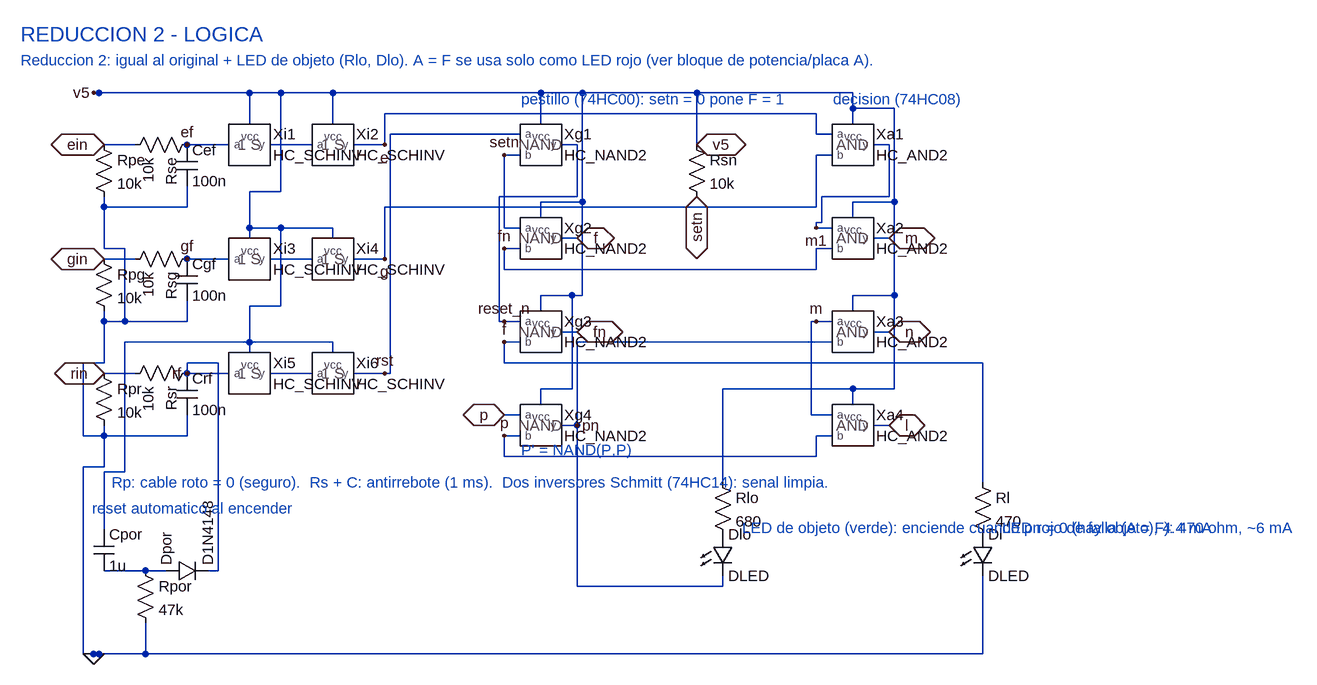
[diagram p0: schematic BLOQUE_LOGICA.asc]
BLOQUE_LOGICA.asc, the LTspice schematic file:
Version 4
SHEET 1 1700 1000
WIRE 48 0 96 0
WIRE 176 0 240 0
WIRE 304 0 368 0
WIRE 432 0 480 0
WIRE 48 176 96 176
WIRE 176 176 240 176
WIRE 304 176 368 176
WIRE 432 176 480 176
WIRE 48 352 96 352
WIRE 176 352 240 352
WIRE 304 352 368 352
WIRE 432 352 480 352
WIRE 48 656 112 656
WIRE 112 656 144 656
WIRE 752 0 776 0
WIRE 720 -32 720 -56
WIRE 688 -16 664 -16
WIRE 688 16 664 16
WIRE 752 144 776 144
WIRE 720 112 720 88
WIRE 688 128 664 128
WIRE 688 160 664 160
WIRE 752 288 776 288
WIRE 720 256 720 232
WIRE 688 272 664 272
WIRE 688 304 664 304
WIRE 752 432 776 432
WIRE 720 400 720 376
WIRE 688 416 664 416
WIRE 688 448 664 448
WIRE 1232 0 1256 0
WIRE 1200 -32 1200 -56
WIRE 1168 -16 1144 -16
WIRE 1168 16 1144 16
WIRE 1232 144 1256 144
WIRE 1200 112 1200 88
WIRE 1168 128 1144 128
WIRE 1168 160 1144 160
WIRE 1232 288 1256 288
WIRE 1200 256 1200 232
WIRE 1168 272 1144 272
WIRE 1168 304 1144 304
WIRE 1232 432 1256 432
WIRE 1200 400 1200 376
WIRE 1168 416 1144 416
WIRE 1168 448 1144 448
WIRE 1144 -16 1144 -48
WIRE 1144 -48 480 -48
WIRE 480 -48 480 0
WIRE 1400 520 1400 336
WIRE 1400 336 664 336
WIRE 664 336 664 304
WIRE 1144 160 1144 192
WIRE 1144 192 664 192
WIRE 664 192 664 160
WIRE 1144 16 1144 96
WIRE 1144 96 480 96
WIRE 480 96 480 176
WIRE 1144 416 1136 416
WIRE 1136 416 1136 272
WIRE 1136 272 1144 272
WIRE 1256 0 1256 80
WIRE 1256 80 1152 80
WIRE 1152 80 1152 120
WIRE 1152 120 1144 120
WIRE 1144 120 1144 128
WIRE 1144 448 1144 480
WIRE 1144 480 664 480
WIRE 664 480 664 448
WIRE 776 0 776 80
WIRE 776 80 656 80
WIRE 656 80 656 272
WIRE 656 272 664 272
WIRE 208 656 224 656
WIRE 224 656 224 336
WIRE 224 336 176 336
WIRE 176 336 176 352
WIRE 664 -16 488 -16
WIRE 488 -16 488 352
WIRE 488 352 480 352
WIRE 664 128 664 16
WIRE 1000 664 1000 680
WIRE 1000 680 776 680
WIRE 776 680 776 432
WIRE 1144 304 776 304
WIRE 776 304 776 432
WIRE 32 -80 1200 -80
WIRE 32 -80 40 -80
WIRE 720 -56 720 -80
WIRE 1200 -56 1200 -80
WIRE 272 -32 272 -80
WIRE 400 -32 400 -80
WIRE 960 0 960 -80
WIRE 720 88 784 88
WIRE 784 88 784 -80
WIRE 1200 88 1264 88
WIRE 1264 88 1264 -56
WIRE 1264 -56 1200 -56
WIRE 720 232 784 232
WIRE 784 232 784 88
WIRE 1200 232 1264 232
WIRE 1264 232 1264 88
WIRE 720 376 768 376
WIRE 768 376 768 232
WIRE 1200 376 1264 376
WIRE 1264 376 1264 232
WIRE 272 144 272 72
WIRE 272 72 320 72
WIRE 320 72 320 -80
WIRE 400 144 400 128
WIRE 400 128 272 128
WIRE 272 320 272 248
WIRE 272 248 320 248
WIRE 320 248 320 128
WIRE 400 320 400 304
WIRE 400 304 272 304
WIRE 1000 520 1000 376
WIRE 1000 376 1200 376
WIRE 48 592 48 504
WIRE 48 504 80 504
WIRE 80 504 80 304
WIRE 80 304 272 304
WIRE 32 784 1400 784
WIRE 32 784 40 784
WIRE 112 736 112 784
WIRE 1400 664 1400 784
WIRE 48 432 48 496
WIRE 48 496 16 496
WIRE 16 496 16 784
WIRE 16 784 32 784
WIRE 176 416 176 448
WIRE 176 448 48 448
WIRE 48 256 48 336
WIRE 48 336 16 336
WIRE 16 336 16 448
WIRE 16 448 48 448
WIRE 176 240 176 272
WIRE 176 272 48 272
WIRE 48 80 48 160
WIRE 48 160 80 160
WIRE 80 160 80 272
WIRE 176 64 176 96
WIRE 176 96 48 96
FLAG 48 0 ein
FLAG 176 0 ef
FLAG 480 0 e
FLAG 48 176 gin
FLAG 176 176 gf
FLAG 480 176 g
FLAG 48 352 rin
FLAG 176 352 rf
FLAG 480 352 rst
FLAG 664 16 setn
FLAG 776 144 f
FLAG 664 160 fn
FLAG 776 288 fn
FLAG 664 272 reset_n
FLAG 664 304 f
FLAG 776 432 pn
FLAG 664 416 p
FLAG 664 448 p
FLAG 960 0 v5
FLAG 960 80 setn
FLAG 1256 144 m
FLAG 1144 128 m1
FLAG 1256 288 n
FLAG 1144 272 m
FLAG 1256 432 l
FLAG 32 -80 v5
FLAG 32 784 0
IOPIN 48 0 BiDir
IOPIN 48 176 BiDir
IOPIN 48 352 BiDir
IOPIN 776 144 BiDir
IOPIN 776 288 BiDir
IOPIN 664 416 BiDir
IOPIN 960 0 BiDir
IOPIN 960 80 BiDir
IOPIN 1256 144 BiDir
IOPIN 1256 288 BiDir
IOPIN 1256 432 BiDir
SYMBOL res 32 -16 R0
SYMATTR InstName Rpe
SYMATTR Value 10k
SYMBOL res 192 -16 R90
SYMATTR InstName Rse
SYMATTR Value 10k
SYMBOL cap 160 0 R0
SYMATTR InstName Cef
SYMATTR Value 100n
SYMBOL HC_SCHINV 272 0 R0
SYMATTR InstName Xi1
SYMATTR Value HC_SCHINV
SYMBOL HC_SCHINV 400 0 R0
SYMATTR InstName Xi2
SYMATTR Value HC_SCHINV
SYMBOL res 32 160 R0
SYMATTR InstName Rpg
SYMATTR Value 10k
SYMBOL res 192 160 R90
SYMATTR InstName Rsg
SYMATTR Value 10k
SYMBOL cap 160 176 R0
SYMATTR InstName Cgf
SYMATTR Value 100n
SYMBOL HC_SCHINV 272 176 R0
SYMATTR InstName Xi3
SYMATTR Value HC_SCHINV
SYMBOL HC_SCHINV 400 176 R0
SYMATTR InstName Xi4
SYMATTR Value HC_SCHINV
SYMBOL res 32 336 R0
SYMATTR InstName Rpr
SYMATTR Value 10k
SYMBOL res 192 336 R90
SYMATTR InstName Rsr
SYMATTR Value 10k
SYMBOL cap 160 352 R0
SYMATTR InstName Crf
SYMATTR Value 100n
SYMBOL HC_SCHINV 272 352 R0
SYMATTR InstName Xi5
SYMATTR Value HC_SCHINV
SYMBOL HC_SCHINV 400 352 R0
SYMATTR InstName Xi6
SYMATTR Value HC_SCHINV
SYMBOL cap 32 592 R0
SYMATTR InstName Cpor
SYMATTR Value 1u
SYMBOL res 96 640 R0
SYMATTR InstName Rpor
SYMATTR Value 47k
SYMBOL diode 144 672 R270
SYMATTR InstName Dpor
SYMATTR Value D1N4148
SYMBOL HC_NAND2 720 0 R0
SYMATTR InstName Xg1
SYMATTR Value HC_NAND2
SYMBOL HC_NAND2 720 144 R0
SYMATTR InstName Xg2
SYMATTR Value HC_NAND2
SYMBOL HC_NAND2 720 288 R0
SYMATTR InstName Xg3
SYMATTR Value HC_NAND2
SYMBOL HC_NAND2 720 432 R0
SYMATTR InstName Xg4
SYMATTR Value HC_NAND2
SYMBOL res 944 -16 R0
SYMATTR InstName Rsn
SYMATTR Value 10k
SYMBOL HC_AND2 1200 0 R0
SYMATTR InstName Xa1
SYMATTR Value HC_AND2
SYMBOL HC_AND2 1200 144 R0
SYMATTR InstName Xa2
SYMATTR Value HC_AND2
SYMBOL HC_AND2 1200 288 R0
SYMATTR InstName Xa3
SYMATTR Value HC_AND2
SYMBOL HC_AND2 1200 432 R0
SYMATTR InstName Xa4
SYMATTR Value HC_AND2
SYMBOL res 984 504 R0
SYMATTR InstName Rlo
SYMATTR Value 680
SYMBOL LED 984 600 R0
SYMATTR InstName Dlo
SYMATTR Value DLED
SYMBOL res 1384 504 R0
SYMATTR InstName Rl
SYMATTR Value 470
SYMBOL LED 1384 600 R0
SYMATTR InstName Dl
SYMATTR Value DLED
TEXT 60 520 Left 2 ;Rp: cable roto = 0 (seguro).  Rs + C: antirrebote (1 ms).  Dos inversores Schmitt (74HC14): senal limpia.
TEXT 30 560 Left 2 ;reset automatico al encender
TEXT 690 -70 Left 2 ;pestillo (74HC00): setn = 0 pone F = 1
TEXT 690 470 Left 2 ;P' = NAND(P,P)
TEXT 1170 -70 Left 2 ;decision (74HC08)
TEXT 1430 590 Left 2 ;LED rojo de falla (A = F): 470 ohm, ~6 mA
TEXT 1030 590 Left 2 ;LED de objeto (verde): enciende cuando pn = 0 (hay objeto), 4.4 mA
TEXT -80 -170 Left 3 ;REDUCCION 2 - LOGICA
TEXT -80 -130 Left 2 ;Reduccion 2: igual al original + LED de objeto (Rlo, Dlo). A = F se usa solo como LED rojo (ver bloque de potencia/placa A).

The netlist it stands for:
* BLOQUE_LOGICA.asc
Rpe ein 0 10k
Rse ef ein 10k
Cef ef 0 100n
XXi1 ef N001 v5 HC_SCHINV  ; pins a y vcc
XXi2 N001 e v5 HC_SCHINV  ; pins a y vcc
Rpg gin 0 10k
Rsg gf gin 10k
Cgf gf 0 100n
XXi3 gf N002 v5 HC_SCHINV  ; pins a y vcc
XXi4 N002 g v5 HC_SCHINV  ; pins a y vcc
Rpr rin 0 10k
Rsr rf rin 10k
Crf rf 0 100n
XXi5 rf N003 v5 HC_SCHINV  ; pins a y vcc
XXi6 N003 rst v5 HC_SCHINV  ; pins a y vcc
Cpor v5 N004 1u
Rpor N004 0 47k
Dpor N004 rf D1N4148
XXg1 rst setn reset_n v5 HC_NAND2  ; pins a b y vcc
XXg2 setn fn f v5 HC_NAND2  ; pins a b y vcc
XXg3 reset_n f fn v5 HC_NAND2  ; pins a b y vcc
XXg4 p p pn v5 HC_NAND2  ; pins a b y vcc
Rsn v5 setn 10k
XXa1 e g m1 v5 HC_AND2  ; pins a b y vcc
XXa2 m1 fn m v5 HC_AND2  ; pins a b y vcc
XXa3 m pn n v5 HC_AND2  ; pins a b y vcc
XXa4 m p l v5 HC_AND2  ; pins a b y vcc
Rlo v5 P001 680
Dlo P001 pn DLED
Rl f P002 470
Dl P002 0 DLED
.model D D
.lib standard.dio
* Rp: cable roto = 0 (seguro).  Rs + C: antirrebote (1 ms).  Dos inversores Schmitt (74HC14): senal limpia.
* reset automatico al encender
* pestillo (74HC00): setn = 0 pone F = 1
* P' = NAND(P,P)
* decision (74HC08)
* LED rojo de falla (A = F): 470 ohm, ~6 mA
* LED de objeto (verde): enciende cuando pn = 0 (hay objeto), 4.4 mA
* REDUCCION 2 - LOGICA
* Reduccion 2: igual al original + LED de objeto (Rlo, Dlo). A = F se usa solo como LED rojo (ver bloque de potencia/placa A).
.backanno
.end